# Altium project DA26111_Kit_ATmega16.PrjPcb
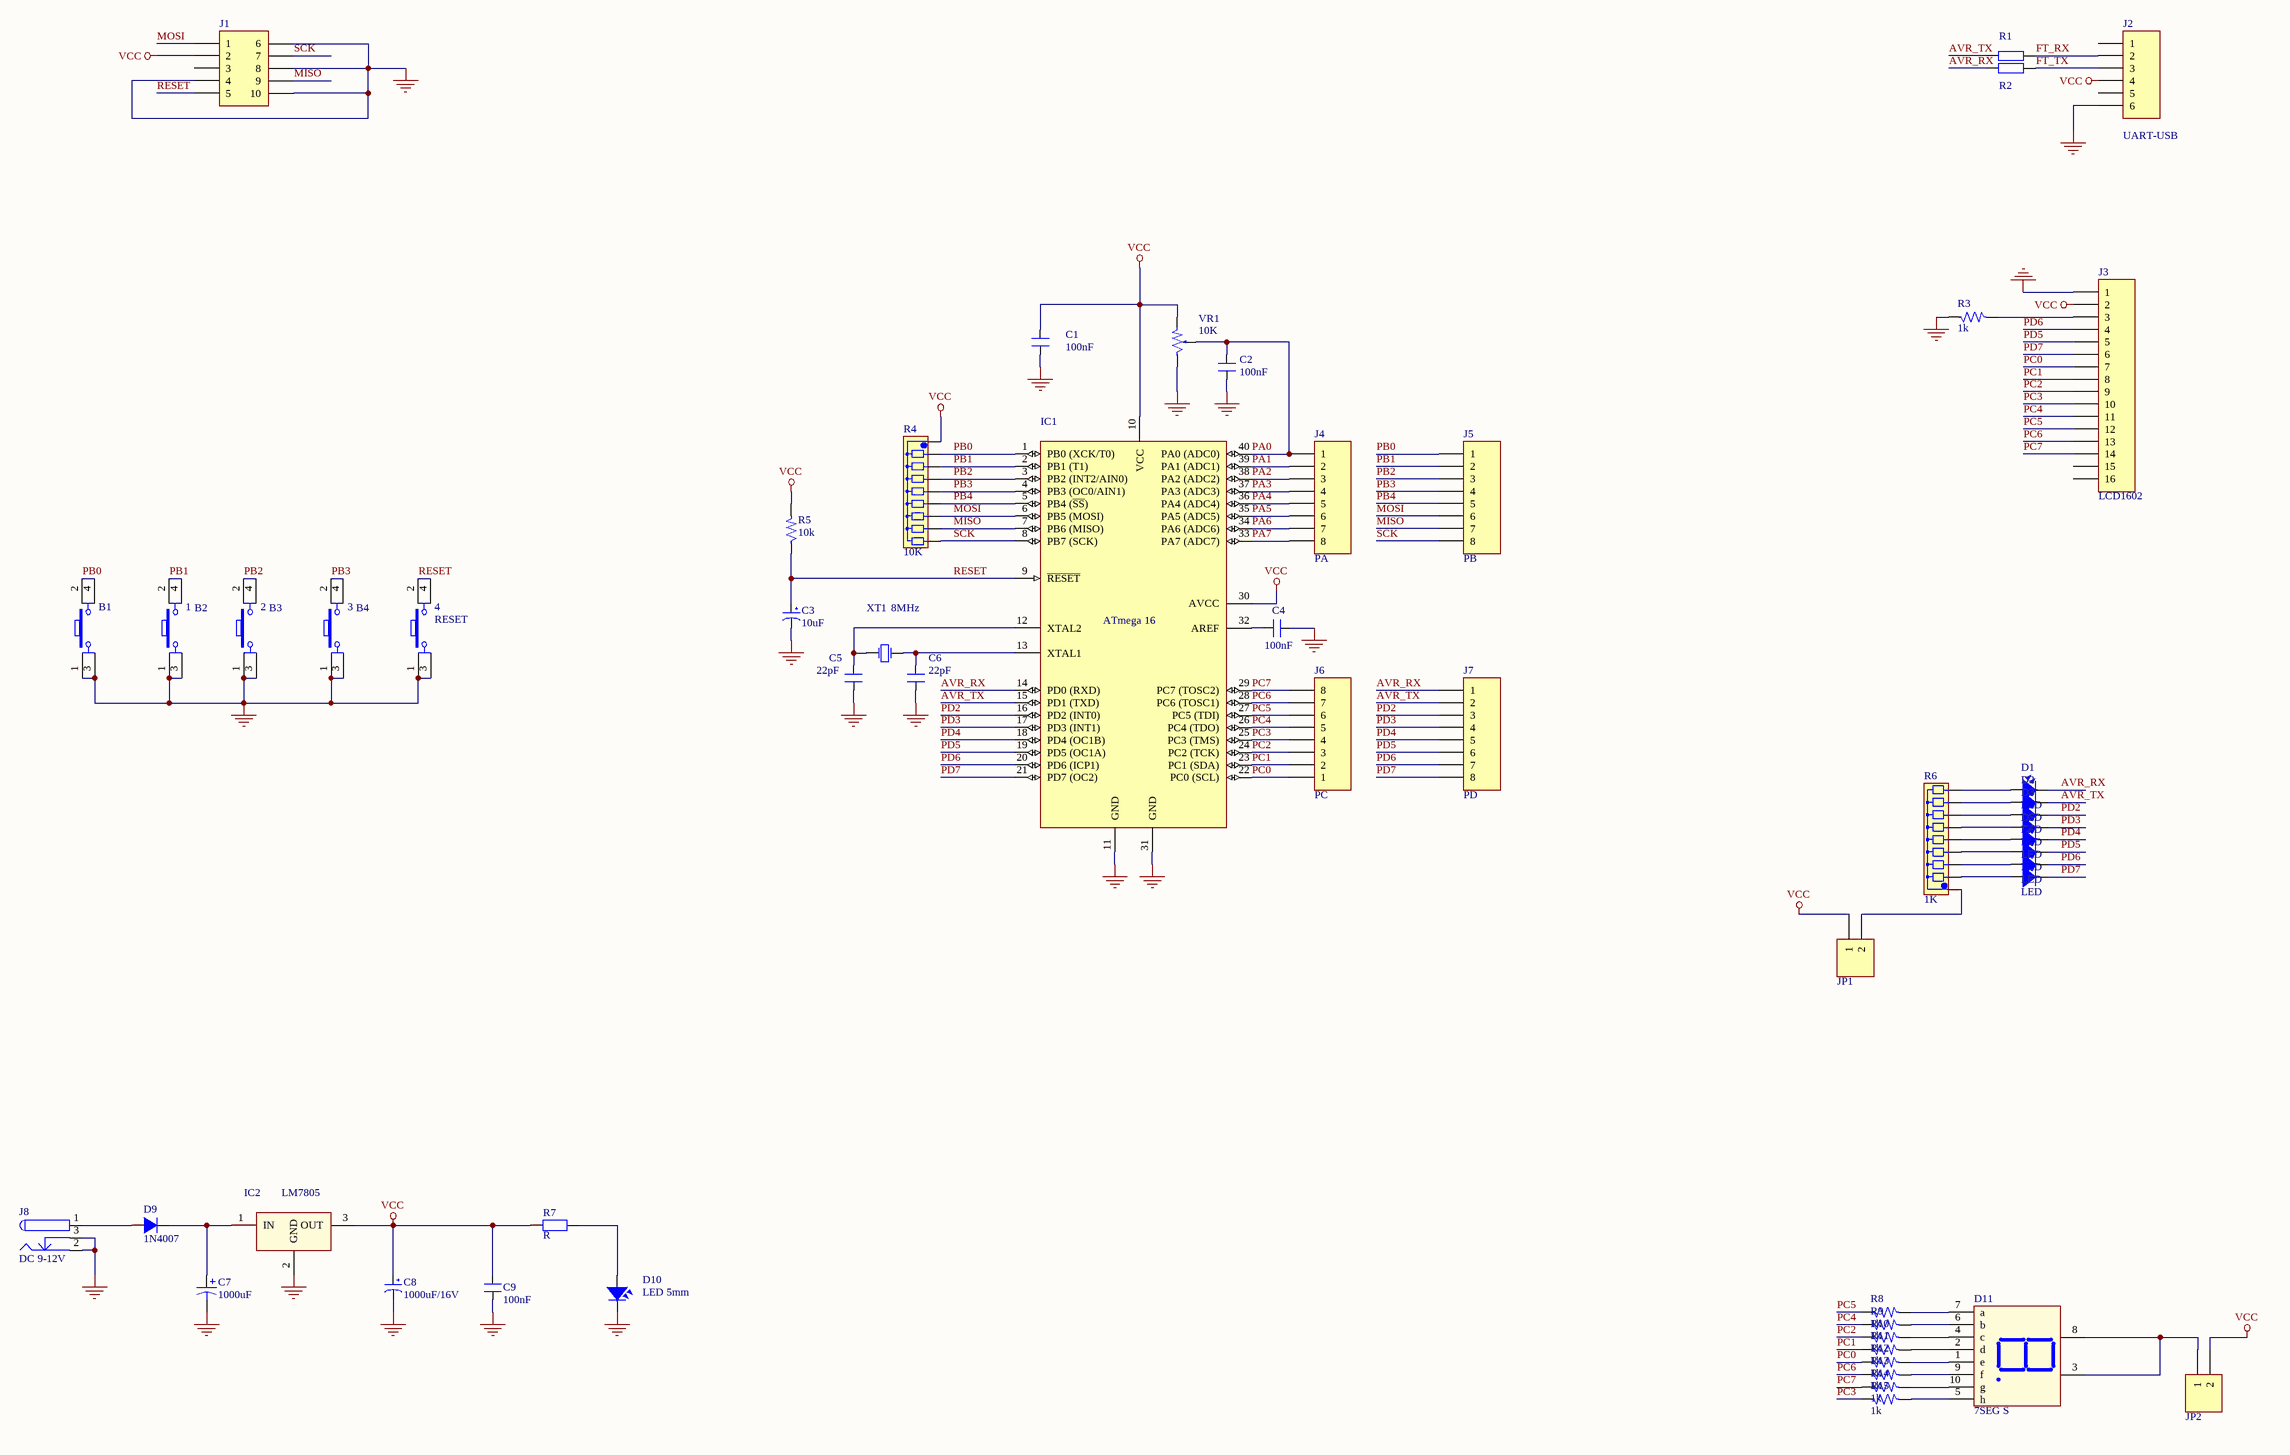
[diagram p0: Schematic_Main.SchDoc]
1 sheet, 54 parts. Net scope: global (net labels, ports and power ports of the same name join across sheets).
Board file: PCB_Layout.PcbDoc

## Sheet Schematic_Main.SchDoc
size C; SheetNumber: 1; SheetTotal: 1

### Parts
1  B2  [SW4]
2  B3  [SW4]
3  B4  [SW4]
4  RESET  [SW4]
B1  (no value)  [SW4]
C1  100nF  [CN2]
C2  100nF  [CN2]
C3  10uF  [CP1/2]
C4  100nF  [CN2]
C5  22pF  [CN2]
C6  22pF  [CN2]
C7  1000uF  [C3MM]
C8  1000uF/16V  [CP1.5/3.4]
C9  100nF  [CN2]
D1  LED  [LED-3]
D2  LED  [LED-3]
D3  LED  [LED-3]
D4  LED  [LED-3]
D5  LED  [LED-3]
D6  LED  [LED-3]
D7  LED  [LED-3]
D8  LED  [LED-3]
D9  1N4007  [D1A]
D10  LED 5mm  [LED-3]
D11  7SEG S  [7SEGS]
IC1  ATmega 16  [DIP40/W0.6]
IC2  LM7805  [QTO-220]
J1  (no value)  [HDR2X5]
J2  UART-USB  [HDR1X6]
J3  LCD1602  [HDR1X16]
J4  PA  [HDR1X8]
J5  PB  [HDR1X8]
J6  PC  [HDR1X8]
J7  PD  [HDR1X8]
J8  DC 9-12V  [PW-J-2MM]
JP1  (no value)  [HDR1X2]
JP2  (no value)  [HDR1X2]
R1  (no value)  [R1/4W]
R2  (no value)  [R1/4W]
R3  1k  [R1/4W]
R4  10K  [RN8]
R5  10k  [R1/4W]
R6  1K  [RN8]
R7  value R  [DIEN TRO 1/4 W]  (hidden comment: R0.4W)
R8  1k  [R1/4W]
R9  1k  [R1/4W]
R10  1k  [R1/4W]
R11  1k  [R1/4W]
R12  1k  [R1/4W]
R13  1k  [R1/4W]
R14  1k  [R1/4W]
R15  1k  [R1/4W]
VR1  10K  [VR]
XT1  8MHz  [XT2]

### Nets
Net1_1: 1.1 1.3 2.1 2.3 3.1 3.3 4.1 4.3 B1.1 B1.3 C1.1 C2.1 C3.2 C4.2 C5.1 C6.1 C7.2 C8.2 C9.1 D10.2 IC1.11(GND) IC1.31(GND) IC2.2(GND) J1.4 J1.6 J1.8 J1.10 J2.6 J3.1 J8.2 J8.3 R3.1 VR1.3
VCC: C1.2 C8.1 C9.2 IC1.10(VCC) IC1.30(AVCC) IC2.3(OUT) J1.2 J2.4 J3.2 JP1.1 JP2.2 R4.1 R5.2 R7.1 VR1.1
AVR_RX: D1.2 IC1.14(PD0_(RXD)) J7.1 R2.1
AVR_TX: D2.2 IC1.15(PD1_(TXD)) J7.2 R1.1
FT_RX: J2.2 R1.2
FT_TX: J2.3 R2.2
MISO: IC1.7(PB6_(MISO)) J1.9 J5.7 R4.8
MOSI: IC1.6(PB5_(MOSI)) J1.1 J5.6 R4.7
PA0: C2.2 IC1.40(PA0_(ADC0)) J4.1 VR1.2
PA1: IC1.39(PA1_(ADC1)) J4.2
PA2: IC1.38(PA2_(ADC2)) J4.3
PA3: IC1.37(PA3_(ADC3)) J4.4
PA4: IC1.36(PA4_(ADC4)) J4.5
PA5: IC1.35(PA5_(ADC5)) J4.6
PA6: IC1.34(PA6_(ADC6)) J4.7
PA7: IC1.33(PA7_(ADC7)) J4.8
PB0: B1.2 B1.4 IC1.1(PB0_(XCK/T0)) J5.1 R4.2
PB1: 1.2 1.4 IC1.2(PB1_(T1)) J5.2 R4.3
PB2: 2.2 2.4 IC1.3(PB2_(INT2/AIN0)) J5.3 R4.4
PB3: 3.2 3.4 IC1.4(PB3_(OC0/AIN1)) J5.4 R4.5
PB4: IC1.5(PB4_(~{SS})) J5.5 R4.6
PC0: IC1.22(PC0_(SCL)) J3.7 J6.1 R12.1
PC1: IC1.23(PC1_(SDA)) J3.8 J6.2 R11.1
PC2: IC1.24(PC2_(TCK)) J3.9 J6.3 R10.1
PC3: IC1.25(PC3_(TMS)) J3.10 J6.4 R15.1
PC4: IC1.26(PC4_(TDO)) J3.11 J6.5 R9.1
PC5: IC1.27(PC5_(TDI)) J3.12 J6.6 R8.1
PC6: IC1.28(PC6_(TOSC1)) J3.13 J6.7 R13.1
PC7: IC1.29(PC7_(TOSC2)) J3.14 J6.8 R14.1
PD2: D3.2 IC1.16(PD2_(INT0)) J7.3
PD3: D4.2 IC1.17(PD3_(INT1)) J7.4
PD4: D5.2 IC1.18(PD4_(OC1B)) J7.5
PD5: D6.2 IC1.19(PD5_(OC1A)) J3.5 J7.6
PD6: D7.2 IC1.20(PD6_(ICP1)) J3.4 J7.7
PD7: D8.2 IC1.21(PD7_(OC2)) J3.6 J7.8
RESET: 4.2 4.4 C3.1 IC1.9(~{RESET}) J1.5 R5.1
SCK: IC1.8(PB7_(SCK)) J1.7 J5.8 R4.9
NetC4_1: C4.1 IC1.32(AREF)
NetC5_2: C5.2 IC1.12(XTAL2) XT1.1(OSC1)
NetC6_2: C6.2 IC1.13(XTAL1) XT1.2(OSC2)
NetC7_1: C7.1 D9.2(K) IC2.1(IN)
NetD1_1: D1.1 R6.9
NetD2_1: D2.1 R6.8
NetD3_1: D3.1 R6.7
NetD4_1: D4.1 R6.6
NetD5_1: D5.1 R6.5
NetD6_1: D6.1 R6.4
NetD7_1: D7.1 R6.3
NetD8_1: D8.1 R6.2
NetD9_1: D9.1(A) J8.1
NetD10_1: D10.1 R7.2
NetD11_1: D11.1(e) R12.2
NetD11_2: D11.2(d) R11.2
NetD11_3: D11.3(Vcc) D11.8(Vcc) JP2.1
NetD11_4: D11.4(c) R10.2
NetD11_5: D11.5(h) R15.2
NetD11_6: D11.6(b) R9.2
NetD11_7: D11.7(a) R8.2
NetD11_9: D11.9(f) R13.2
NetD11_10: D11.10(g) R14.2
NetJ3_3: J3.3 R3.2
NetJP1_2: JP1.2 R6.1

Not connected (* = marked no-connect by the designer): J1 3; J2 1 5; J3 15 16

### Library data of the parts
1-4 B1 = SW4: Switch button 4 pin; Value: Button chip 4 pin
C1 C2 C4 = CN2: Cap np 104 => 105pF; Value: 0.1uF
C3 = CP1: Cap P  0,1uF < 22uF , 16 - 50V; Value: 10uF/50V; Description 1: 10 => 220uF/6,3V/10V - 10uF => 100uF/16V; Description 2: 0,1uF => 33uF/50V - 10uF => 22uF/63V; Description 3: 0,47uF => 10uF/100V
C5 C6 C9 = CN2: Cap np 104 => 105pF
  C5 C6: Value: 22pF
  C9: Value: 100nF
C7 = Cap Pol 3mm: Polarized Capacitor (Axial); Published: 8-Jun-2000; LatestRevisionDate: 17-Jul-2002; LatestRevisionNote: Re-released for DXP Platform.; PackageReference: POLAR0.8; Publisher: Altium Limited
C8 = CP4: Cap 1000uF/16V - 220uF/50V; Description 5: 4,7uF>10uF/250V_3,3uF>10uF/400V - 2,2uF>4,7uF/450V; Description 1: 2200uF-3300uF/6,3V - 1000uF-2200uF/10V; Description 2: 1000uF/16V - 470uF => 1000uF/25V - 100uF/100V; Description 3: 330uF>470uF/35V_220uF>470uF/50V_10uF>22uF/250V; Description 4: 220uF => 330uF/63V - 10uF =>33uF/160 - 200V; Value: 1000uF/16V
D1-D8 D10 = LED: LED Single colour Green and Red; Value: LED 3 ly Single Colour
D9 = D1A: Diode 1A; Value: 1N4007
D11 = LED7S_1: Single 7 Seg Dipslay; Value: LED 7S SEG
IC1 = ATmega16A-PU: 8-Bit AVR Microcontroller with 16K Bytes of In-System Programmable Flash Memory; Value: Atmega 16L
IC2 = LM78xx: On ap +, from + 5 to + 24VDC; Value: LM7805
J1 = Header 5X2: Header, 5-Pin, Dual row; LatestRevisionDate: 17-Jul-2002; LatestRevisionNote: Re-released for DXP Platform.; Publisher: Altium Limited
J2 = Header 6: Header, 6-Pin; LatestRevisionDate: 17-Jul-2002; LatestRevisionNote: Re-released for DXP Platform.; Publisher: Altium Limited
J3 = Header 16: Header, 16-Pin; LatestRevisionDate: 17-Jul-2002; LatestRevisionNote: Re-released for DXP Platform.; Publisher: Altium Limited
J4-J7 = Header 8: Header, 8-Pin; LatestRevisionDate: 17-Jul-2002; LatestRevisionNote: Re-released for DXP Platform.; Publisher: Altium Limited
J8 = PWR2.5: Low Voltage Power Supply Connector; Published: 17-Dec-2003; DatasheetDocument: 09-May-2002; Publisher: Altium Limited; ComponentLink1Description: Manufacturer Link; ComponentLink1URL: http://domino.kycon.com/internet/Products.html
JP1 JP2 = Header 2: Header, 2-Pin; LatestRevisionDate: 17-Jul-2002; LatestRevisionNote: Re-released for DXP Platform.; Publisher: Altium Limited
R1 R2 = R1/4W: Resistor 1/4W; Value: R1/4W - 100
R3 R8-R15 = R: Resistor 1/4W; Value: R1/4W - 1K
R4 = RN8: Resistor 8 (Thanh); Value: Tro thanh 10K
R5 = R: Resistor 1/4W; Value: R1/4W - 10K
R6 = RN8: Resistor 8 (Thanh); Value: Tro thanh 1K
R7 = Res 1/4 W: Resistor; Published: 8-Jun-2000; LatestRevisionDate: 17-Jul-2002; LatestRevisionNote: Re-released for DXP Platform.; PackageReference: AXIAL-0.4; Publisher: Altium Limited
VR1 = VR1: Var Resistor; Value: VR 10K
XT1 = Crystal: Crystal Oscillator; Published: 8-Jun-2000; LatestRevisionDate: 17-Jul-2002; LatestRevisionNote: Re-released for DXP Platform.; PackageReference: R38; Publisher: Altium Limited